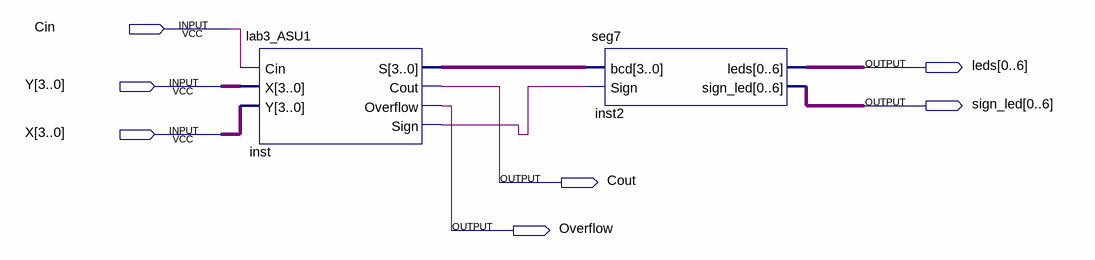
[diagram p0: schematic sheet]
// Quartus schematic ASU_COMBINED.bdf as structural Verilog: 2 symbols, 7 pins
module ASU_COMBINED (
  input  Cin,
  input  [3:0] Y,
  input  [3:0] X,
  output [0:6] leds,
  output [0:6] sign_led,
  output Cout,
  output Overflow
);

  wire inst_sign;
  wire [3:0] inst_s;

  lab3_ASU1 inst (.Cin(Cin), .X(Y), .Y(X), .S(inst_s), .Cout(Cout), .Overflow(Overflow), .Sign(inst_sign));
  seg7 inst2 (.bcd(inst_s), .Sign(inst_sign), .leds(leds), .sign_led(sign_led));
endmodule
